# Altium schematic sheet LTE_Sheet.SchDoc
size 420 x 297 mm; SheetNumber: 11; SheetTotal: 12
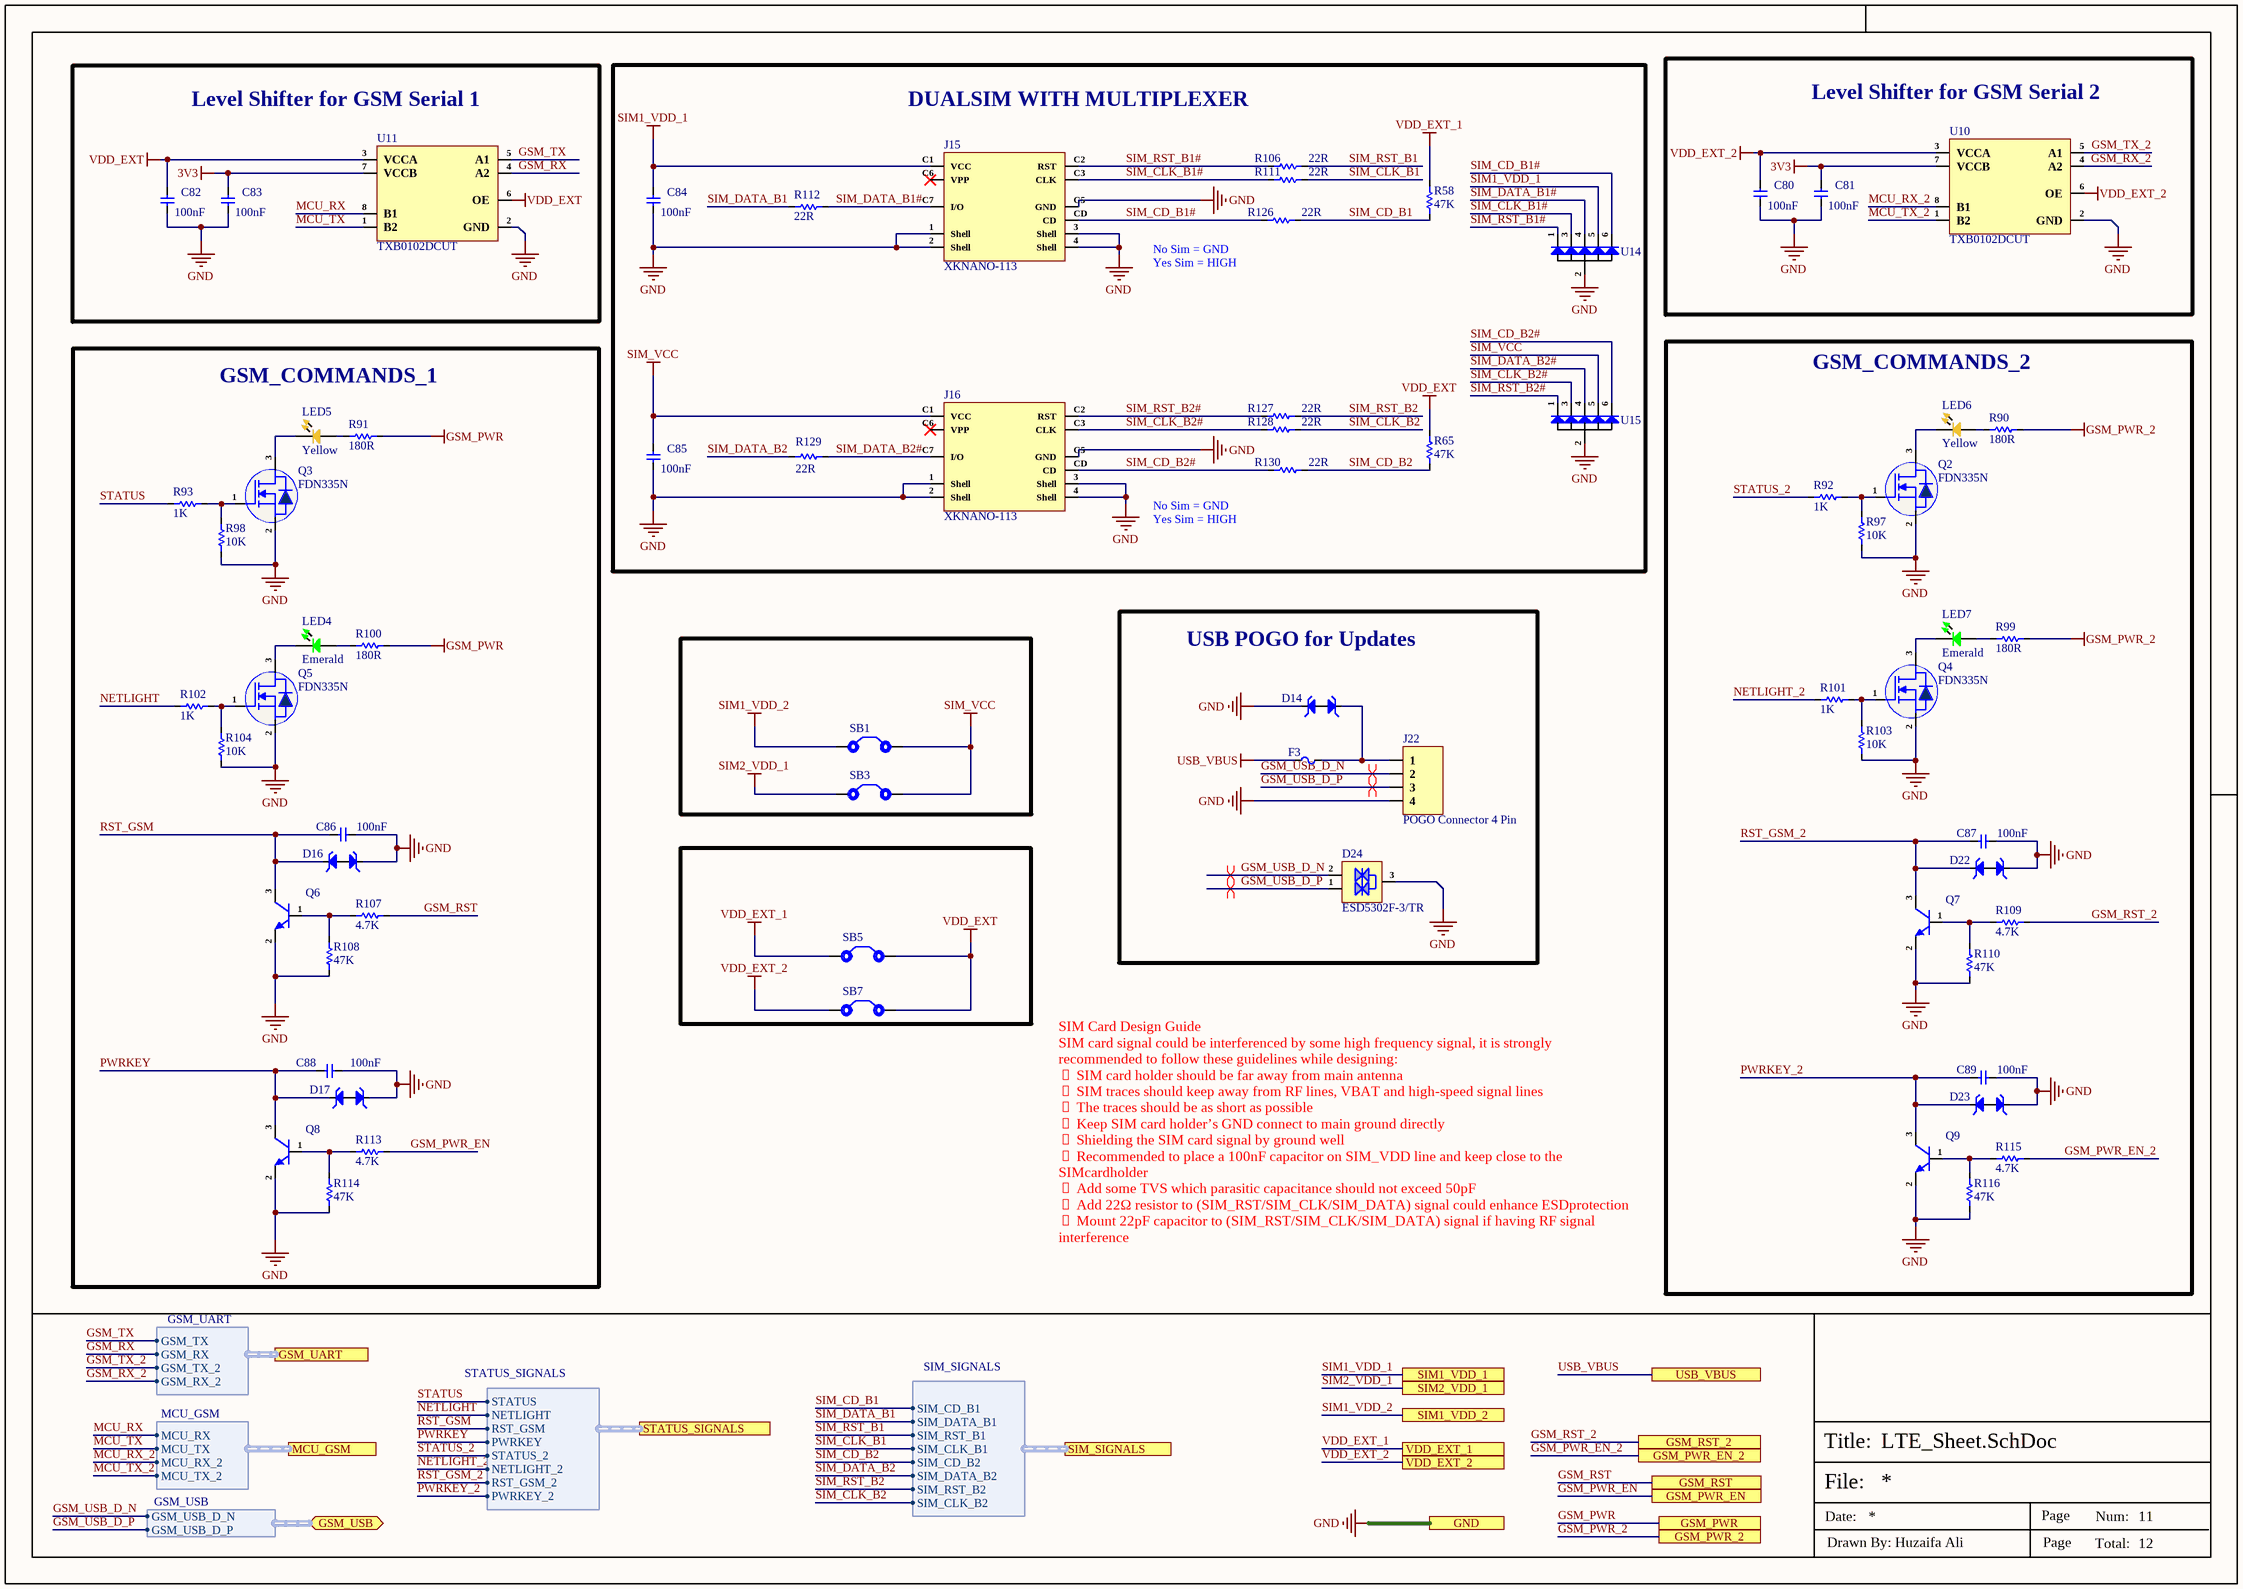
[diagram p0: LTE_Sheet.SchDoc]

## Parts
C80  100nF  [CAP-0201]
C81  100nF  [CAP-0201]
C82  100nF  [CAP-0201]
C83  100nF  [CAP-0201]
C84  100nF  [CAP-0201]
C85  100nF  [CAP-0201]
C86  100nF  [CAP-0201]
C87  100nF  [CAP-0201]
C88  100nF  [CAP-0201]
C89  100nF  [CAP-0201]
D14  PESD5V0H1BSFYL  [DSN0603-2]  (value not drawn)
D16  PESD5V0H1BSFYL  [DSN0603-2]  (value not drawn)
D17  PESD5V0H1BSFYL  [DSN0603-2]  (value not drawn)
D22  PESD5V0H1BSFYL  [DSN0603-2]  (value not drawn)
D23  PESD5V0H1BSFYL  [DSN0603-2]  (value not drawn)
D24  ESD5302F-3/TR  [Sot-23]
F3  SMD0603-050  [Fuse-0603]  (value not drawn)
J15  XKNANO-113  [XKNANO-113]
J16  XKNANO-113  [XKNANO-113]
J22  POGO Connector 4 Pin  [Pogo 4 Pin]
LED4  Emerald  [LED-0603]
LED5  Yellow  [LED-0603]
LED6  Yellow  [LED-0603]
LED7  Emerald  [LED-0603]
Q2  FDN335N  [SOT-23]
Q3  FDN335N  [SOT-23]
Q4  FDN335N  [SOT-23]
Q5  FDN335N  [SOT-23]
Q6  MMBT3904M  [SOT-723]  (value not drawn)
Q7  MMBT3904M  [SOT-723]  (value not drawn)
Q8  MMBT3904M  [SOT-723]  (value not drawn)
Q9  MMBT3904M  [SOT-723]  (value not drawn)
R58  47K  [Res-0201]
R65  47K  [Res-0201]
R90  180R  [Res-0201]
R91  180R  [Res-0201]
R92  1K  [Res-0603]
R93  1K  [Res-0603]
R97  10K  [Res-0201]
R98  10K  [Res-0201]
R99  180R  [Res-0201]
R100  180R  [Res-0201]
R101  1K  [Res-0603]
R102  1K  [Res-0603]
R103  10K  [Res-0201]
R104  10K  [Res-0201]
R106  22R  [Res-0201]
R107  4.7K  [Res-0603]
R108  47K  [Res-0603]
R109  4.7K  [Res-0603]
R110  47K  [Res-0603]
R111  22R  [Res-0201]
R112  22R  [Res-0201]
R113  4.7K  [Res-0603]
R114  47K  [Res-0603]
R115  4.7K  [Res-0603]
R116  47K  [Res-0603]
R126  22R  [Res-0201]
R127  22R  [Res-0201]
R128  22R  [Res-0201]
R129  22R  [Res-0201]
R130  22R  [Res-0201]
SB1  Solder Bridge 0603  [Solder Bridge]  (value not drawn)  (no BOM)
SB3  Solder Bridge 0603  [Solder Bridge]  (value not drawn)  (no BOM)
SB5  Solder Bridge 0603  [Solder Bridge]  (value not drawn)  (no BOM)
SB7  Solder Bridge 0603  [Solder Bridge]  (value not drawn)  (no BOM)
U10  TXB0102DCUT  [TXB0102DCUT]
U11  TXB0102DCUT  [TXB0102DCUT]
U14  SMF05CT1G-ES  [SOT-363]  (value not drawn)
U15  SMF05CT1G-ES  [SOT-363]  (value not drawn)

## Blocks framed on the sheet
Level Shifter for GSM Serial 1: C82 C83 U11
DUALSIM WITH MULTIPLEXER: C84 C85 J15 J16 R58 R65 R106 R111 R112 R126-R130 U14 U15
Level Shifter for GSM Serial 2: C80 C81 U10
GSM_COMMANDS_1: C86 C88 D16 D17 LED4 LED5 Q3 Q5 Q6 Q8 R91 R93 R98 R100 R102 R104 R107 R108 R113 R114
GSM_COMMANDS_2: C87 C89 D22 D23 LED6 LED7 Q2 Q4 Q7 Q9 R90 R92 R97 R99 R101 R103 R109 R110 R115 R116
USB POGO for Updates: D14 D24 F3 J22

## Ports
GND, GSM_PWR, GSM_PWR_2, GSM_PWR_EN, GSM_PWR_EN_2, GSM_RST, GSM_RST_2, GSM_UART (harness GSM_UART), GSM_USB (bidir, harness GSM_USB), MCU_GSM (harness MCU_GSM), SIM1_VDD_1, SIM1_VDD_2, SIM2_VDD_1, SIM_SIGNALS (harness SIM_SIGNALS), STATUS_SIGNALS (harness STATUS_SIGNALS), USB_VBUS, VDD_EXT_1, VDD_EXT_2

## Harnesses
SIM_SIGNALS: SIM_CD_B1, SIM_DATA_B1, SIM_RST_B1, SIM_CLK_B1, SIM_CD_B2, SIM_DATA_B2, SIM_RST_B2, SIM_CLK_B2
GSM_UART: GSM_TX, GSM_RX, GSM_TX_2, GSM_RX_2
MCU_GSM: MCU_RX, MCU_TX, MCU_RX_2, MCU_TX_2
STATUS_SIGNALS: NETLIGHT, STATUS, RST_GSM, PWRKEY, NETLIGHT_2, STATUS_2, RST_GSM_2, PWRKEY_2
GSM_USB: GSM_USB_D_N, GSM_USB_D_P

## Nets
3V3: C81.2 C83.2 U10.7(VCCB) U11.7(VCCB)
GND: C80.1 C81.1 C82.1 C83.1 C84.1 C85.1 C86.1 C87.1 C88.1 C89.1 D14.1 D16.2 D17.2 D22.2 D23.2 D24.3(GND) J15.1(Shell) J15.2(Shell) J15.3(Shell) J15.4(Shell) J15.C5(GND) J16.1(Shell) J16.2(Shell) J16.3(Shell) J16.4(Shell) J16.C5(GND) J22.4 Q2.2(S) Q3.2(S) Q4.2(S) Q5.2(S) Q6.2(E) Q7.2(E) Q8.2(E) Q9.2(E) R97.1 R98.1 R103.1 R104.1 R108.1 R110.1 R114.1 R116.1 U10.2(GND) U11.2(GND) U14.2(A) U15.2(A) ; port GND
GSM_PWR: R91.2 R100.2 ; port GSM_PWR
GSM_PWR_2: R90.2 R99.2 ; port GSM_PWR_2
SIM1_VDD_1: C84.2 J15.C1(VCC) U14.5(IO4) ; port SIM1_VDD_1
SIM1_VDD_2: SB1.1 ; port SIM1_VDD_2
SIM2_VDD_1: SB3.1 ; port SIM2_VDD_1
SIM_VCC: C85.2 J16.C1(VCC) SB1.2 SB3.2 U15.5(IO4)
USB_VBUS: F3.1 ; port USB_VBUS
VDD_EXT: C82.2 R65.2 SB5.2 SB7.2 U11.3(VCCA) U11.6(OE)
VDD_EXT_1: R58.2 SB5.1 ; port VDD_EXT_1
VDD_EXT_2: C80.2 SB7.1 U10.3(VCCA) U10.6(OE) ; port VDD_EXT_2
GSM_PWR_EN: R113.2 ; port GSM_PWR_EN
GSM_PWR_EN_2: R115.2 ; port GSM_PWR_EN_2
GSM_RST: R107.2 ; port GSM_RST
GSM_RST_2: R109.2 ; port GSM_RST_2
GSM_RX: U11.4(A2) ; port GSM_UART.GSM_RX
GSM_RX_2: U10.4(A2) ; port GSM_UART.GSM_RX_2
GSM_TX: U11.5(A1) ; port GSM_UART.GSM_TX
GSM_TX_2: U10.5(A1) ; port GSM_UART.GSM_TX_2
GSM_USB_D_N: D24.2(I/O2) J22.2 ; port GSM_USB.GSM_USB_D_N
GSM_USB_D_P: D24.1(I/O1) J22.3 ; port GSM_USB.GSM_USB_D_P
MCU_RX: U11.8(B1) ; port MCU_GSM.MCU_RX
MCU_RX_2: U10.8(B1) ; port MCU_GSM.MCU_RX_2
MCU_TX: U11.1(B2) ; port MCU_GSM.MCU_TX
MCU_TX_2: U10.1(B2) ; port MCU_GSM.MCU_TX_2
NETLIGHT: R102.1 ; port STATUS_SIGNALS.NETLIGHT
NETLIGHT_2: R101.1 ; port STATUS_SIGNALS.NETLIGHT_2
PWRKEY: C88.2 D17.1 Q8.3(C) ; port STATUS_SIGNALS.PWRKEY
PWRKEY_2: C89.2 D23.1 Q9.3(C) ; port STATUS_SIGNALS.PWRKEY_2
RST_GSM: C86.2 D16.1 Q6.3(C) ; port STATUS_SIGNALS.RST_GSM
RST_GSM_2: C87.2 D22.1 Q7.3(C) ; port STATUS_SIGNALS.RST_GSM_2
SIM_CD_B1: R58.1 R126.2 ; port SIM_SIGNALS.SIM_CD_B1
SIM_CD_B1#: J15.CD R126.1 U14.6(IO5)
SIM_CD_B2: R65.1 R130.2 ; port SIM_SIGNALS.SIM_CD_B2
SIM_CD_B2#: J16.CD R130.1 U15.6(IO5)
SIM_CLK_B1: R111.2 ; port SIM_SIGNALS.SIM_CLK_B1
SIM_CLK_B1#: J15.C3(CLK) R111.1 U14.3(IO2)
SIM_CLK_B2: R128.2 ; port SIM_SIGNALS.SIM_CLK_B2
SIM_CLK_B2#: J16.C3(CLK) R128.1 U15.3(IO2)
SIM_DATA_B1: R112.1 ; port SIM_SIGNALS.SIM_DATA_B1
SIM_DATA_B1#: J15.C7(I/O) R112.2 U14.4(IO3)
SIM_DATA_B2: R129.1 ; port SIM_SIGNALS.SIM_DATA_B2
SIM_DATA_B2#: J16.C7(I/O) R129.2 U15.4(IO3)
SIM_RST_B1: R106.2 ; port SIM_SIGNALS.SIM_RST_B1
SIM_RST_B1#: J15.C2(RST) R106.1 U14.1(IO1)
SIM_RST_B2: R127.2 ; port SIM_SIGNALS.SIM_RST_B2
SIM_RST_B2#: J16.C2(RST) R127.1 U15.1(IO1)
STATUS: R93.1 ; port STATUS_SIGNALS.STATUS
STATUS_2: R92.1 ; port STATUS_SIGNALS.STATUS_2
NetD14_2: D14.2 F3.2 J22.1
NetLED4_1: LED4.1 R100.1
NetLED4_2: LED4.2 Q5.3(D)
NetLED5_1: LED5.1 R91.1
NetLED5_2: LED5.2 Q3.3(D)
NetLED6_1: LED6.1 R90.1
NetLED6_2: LED6.2 Q2.3(D)
NetLED7_1: LED7.1 R99.1
NetLED7_2: LED7.2 Q4.3(D)
NetQ2_1: Q2.1(G) R92.2 R97.2
NetQ3_1: Q3.1(G) R93.2 R98.2
NetQ4_1: Q4.1(G) R101.2 R103.2
NetQ5_1: Q5.1(G) R102.2 R104.2
NetQ6_1: Q6.1(B) R107.1 R108.2
NetQ7_1: Q7.1(B) R109.1 R110.2
NetQ8_1: Q8.1(B) R113.1 R114.2
NetQ9_1: Q9.1(B) R115.1 R116.2

Not connected (* = marked no-connect by the designer): J15 C6(VPP)*; J16 C6(VPP)*

## Layout directives
differential pair; net class GSM_USB; differential pair class GSM_USB_Lines; rule Impedance Constraint [Min = 88.00    Max = 90.00    ]; rule Matched Net Lengths [Tolerance = 20mil]: GSM_USB_D_N, GSM_USB_D_P

## Notes on the sheet
- (near R126) No Sim = GND
  Yes Sim = HIGH
- (near R130) No Sim = GND
  Yes Sim = HIGH
- SIM Card Design Guide
  SIM card signal could be interferenced by some high frequency signal, it is strongly recommended to follow these guidelines while designing:
   SIM card holder should be far away from main antenna
   SIM traces should keep away from RF lines, VBAT and high-speed signal lines
   The traces should be as short as possible
   Keep SIM card holder’s GND connect to main ground directly
   Shielding the SIM card signal by ground well
   Recommended to place a 100nF capacitor on SIM_VDD line and keep close to the SIMcardholder
   Add some TVS which parasitic capacitance should not exceed 50pF
   Add 22Ω resistor to (SIM_RST/SIM_CLK/SIM_DATA) signal could enhance ESDprotection  Mount 22pF capacitor to (SIM_RST/SIM_CLK/SIM_DATA) signal if having RF signal interference
  Datasheet Pg 31
- File:
- Title:
- Date:
- Page
- Num:
- Total:
- Drawn By: Huzaifa Ali

## Library data of the parts
C80-C89 = CC0201KRX5R6BB104: CAP CER 0.1UF 10V X5R 0201; Manufacturer: Yageo; Tolerance: 10%; Supplier 1: Mouser; Manufacturer Part Number: CC0201KRX5R6BB104; RoHS: Yes; Category: Ceramic Capacitors; Stock 1: 824403; Pricing 1: 1=0.10000, 10=0.02400, 50=0.02400, 100=0.01900, 1000=0.01100, 10000=0.00900 (USD); Mount: Surface Mount; Case/Package: 0201; Case Code (Imperial): 0201; Case Code (Metric): 0603; Weight: 6E-06oz; Min Operating Temperature: -55°C; Max Operating Temperature: 85°C; Capacitance: 100nF; Dielectric: X5R; Voltage Rating (DC): 10V; Packaging: Tape and Reel; Termination: SMD/SMT; Resistor Type: Ceramic; Voltage Rating: 10V; Series: CC; Construction: Flat; Length: 0.6mm; Width: 0.012inch; Height: 0.3mm; Thickness: 0.013inch; Depth: 0.3mm; Radiation Hardening: No; Lead Free: Lead Free; Halogen Free: Halogen Free; RoHS Compliant: Yes; ComponentLink1URL: https://datasheet.ciiva.com/11587/upy-gphc-x5r-4v-to-50v-12-11587190.pdf?src-supplier=Avnet; ComponentLink1Description: https://datasheet.ciiva.com/11587/upy-gphc-x5r-4v-to-50v-12-11587190.pdf?src-supplier=Avnet; Supplier Part Number 1: 603-CC201KRX5R6BB104; LCSC Part Number: C190183
D14 D16 D17 D22 D23 = PESD5V0H1BSFYL: TVS DIODE 5VWM 6.3VC DSN0603-2; Manufacturer: Nexperia; Supplier 1: Avnet; Manufacturer Part Number: PESD5V0H1BSFYL; RoHS: Yes; Category: ESD and Circuit Protection ICs; Stock 1: 9000; Pricing 1: 18000=0.06453, 36000=0.06278, 54000=0.06104, 90000=0.05930, 180000=0.05755, 900000=0.05581, 1800000=0.05406 (USD); RoHS Compliant: Yes; ComponentLink1URL: http://www.farnell.com/datasheets/1961312.pdf?src-supplier=Farnell; ComponentLink1Description: http://www.farnell.com/datasheets/1961312.pdf?src-supplier=Farnell; ComponentLink2URL: https://assets.nexperia.com/documents/data-sheet/PESD5V0H1BSF.pdf?src-supplier=Digi-Key; ComponentLink2Description: https://assets.nexperia.com/documents/data-sheet/PESD5V0H1BSF.pdf?src-supplier=Digi-Key; ComponentLink3URL: http://www.farnell.com/datasheets/1961312.pdf?src-supplier=Newark; ComponentLink3Description: http://www.farnell.com/datasheets/1961312.pdf?src-supplier=Newark; Supplier Part Number 1: PESD5V0H1BSFYL; LCSC Part Number: C477989; Item Type: Diode
D24 = ESD5302F-3/TR: 16A 20V 7V 5V@Max Unidirectional SOT-23 TVS ROHS; Manufacturer: WILLSEMI; Item Type: Diode; Manufacturer Part Number: ESD5302F-3/TR; Package: SOT-23; LCSC Part Number: C239643; ComponentLink1Description: LCSC; ComponentLink1URL: https://www.lcsc.com/product-detail/TVS_WILLSEMI-Will-Semicon-ESD5302F-3-TR_C239643.html
F3 = SMD0603-050: 6V 500mA 40A 1A 0603 Resettable Fuses ROHS; Manufacturer: TECHFUSE; Item Type: Fuse; Supplier 1: LCSC; Manufacturer Part Number: SMD0603-050; RoHS: No; Category: Uncategorized; Supplier Part Number 1: C69679; LCSC Part Number: C69679; ComponentLink1Description: LCSC; ComponentLink1URL: https://www.lcsc.com/product-detail/Resettable-Fuses_TECHFUSE-SMD0603-050_C69679.html
J15 J16 = XKNANO-113: Copper Alloy Self bomb Gold plating 1.25mm Deck -40℃~+85℃ 260℃ NanoSIM SMD SIM Card Connectors ROHS; Manufacturer: XKB Connectivity; Manufacturer Part Number: XKNANO-113; Package: SMD Custom; LCSC Part Number: C381071; Item Type: SIM Card Connectors; ComponentLink1Description: LCSC; ComponentLink1URL: https://www.lcsc.com/product-detail/SIM-Card-Connectors_XKB-Connectivity-XKNANO-113_C381071.html
J22 = POGO Connector 4 Pin: Pogo Pad 2.5mm 4 Pin; Item Type: Pogo Connector; Manufacturer Part Number: POGO Connector 4 Pin
LED4 LED7 = NCD0603G2: Emerald 0603 Light Emitting Diodes (LED) ROHS; Manufacturer: Foshan NationStar Optoelectronics; Manufacturer Part Number: NCD0603G2; Package: 0603; LCSC Part Number: C87326; Item Type: LED; ComponentLink1Description: LCSC; ComponentLink1URL: https://www.lcsc.com/product-detail/Light-Emitting-Diodes-LED_Foshan-NationStar-Optoelectronics-NCD0603G2_C87326.html
LED5 LED6 = NCD0603Y2: yellow 0603 Light Emitting Diodes (LED) ROHS; Manufacturer: Foshan NationStar Optoelectronics; Manufacturer Part Number: NCD0603Y2; Package: 0603; LCSC Part Number: C89811; Item Type: LED; ComponentLink1Description: LCSC; ComponentLink1URL: https://www.lcsc.com/product-detail/Light-Emitting-Diodes-LED_Foshan-NationStar-Optoelectronics-NCD0603Y2_C89811.html
Q2-Q5 = FDN335N: SOT-23 MOSFETs ROHS; Manufacturer: TECH PUBLIC; Item Type: Mosfet; Manufacturer Part Number: FDN335N; Package: SOT-23; LCSC Part Number: C5123904; ComponentLink1Description: LCSC; ComponentLink1URL: https://www.lcsc.com/product-detail/MOSFETs_TECH-PUBLIC-FDN335N_C5123904.html
Q6-Q9 = MMBT3904M: 40V 100mW 100@10mA,1V 200mA 300MHz 300mV@50mA,5mA NPN -55℃~+150℃@(Tj) SOT-723 Bipolar Transistors - BJT ROHS; Manufacturer: TECH PUBLIC; Item Type: Mosfet; ComponentLink1Description: LCSC; ComponentLink1URL: https://www.lcsc.com/product-detail/Bipolar-Transistors-BJT_TECH-PUBLIC-MMBT3904M_C2923360.html; Manufacturer Part Number: MMBT3904M; Package: SOT-723; LCSC Part Number: C2923360
R58 R65 = RC0201FR-0747KL: RES 47K OHM 1% 1/20W 0201; Manufacturer: Yageo; Value: 47kR; Temperature Coefficient: 200ppm/°C; Power Rating: 50mW; Voltage Rating: 25V; Item Type: Resistor; Supplier: Future Electronics; Supplier Part Number: 7316417; Manufacturer Part Number: RC0201FR-0747KL; RoHS: Yes; Category: Chip SMD Resistors; Stock: 1020000; Pricing: 10000=0.0014, 50000=0.0013, 250000=0.0013, 750000=0.0012, 2000000=0.0011 (USD); Case/Package: 0201; Contact Plating: Tin,Matte; Case Code (Metric): 0603; Case Code (Imperial): 0201; Weight: 6E-06oz; Min Operating Temperature: -55°C; Max Operating Temperature: 125°C; Tolerance: 1%; Resistor Type: Thick Film; Packaging: Tape and Reel; Package Quantity: 10000; Number of Terminations: 2; Termination: SMD/SMT; Max Power Dissipation: 50mW; Features: Moisture Resistant; Series: RC; Resistance Tolerance: 1%; Construction: Rectangular; Length: 0.6mm; Width: 0.3mm; Height: 0.01inch; Depth: 0.3mm; Military Standard: Not; RoHS Compliant: Yes; Reach SVHC Compliant: Unknown; Lead Free: 5697LeadFree; ComponentLink1URL: https://datasheet.ciiva.com/7672/1563626-7672232.pdf?src-supplier=Element14; ComponentLink1Description: https://datasheet.ciiva.com/7672/1563626-7672232.pdf?src-supplier=Element14; ComponentLink2URL: https://datasheet.ciiva.com/29710/pyu-r-int-thick-7-29710919.pdf?src-supplier=Digi-Key; ComponentLink2Description: https://datasheet.ciiva.com/29710/pyu-r-int-thick-7-29710919.pdf?src-supplier=Digi-Key; ComponentLink3URL: https://datasheet.ciiva.com/29710/pyu-r-int-thick-7-29710920.pdf?src-supplier=Digi-Key; ComponentLink3Description: https://datasheet.ciiva.com/29710/pyu-r-int-thick-7-29710920.pdf?src-supplier=Digi-Key; ComponentLink4URL: https://datasheet.ciiva.com/25647/pyu-r-int-thick-7-25647310.pdf?src-supplier=Digi-Key; ComponentLink4Description: https://datasheet.ciiva.com/25647/pyu-r-int-thick-7-25647310.pdf?src-supplier=Digi-Key; ComponentLink5URL: https://datasheet.ciiva.com/26829/getdatasheetpartid-422496-26829867.pdf?src-supplier=Verical; ComponentLink5Description: https://datasheet.ciiva.com/26829/getdatasheetpartid-422496-26829867.pdf?src-supplier=Verical; ComponentLink6URL: https://datasheet.ciiva.com/8889/pyu-rc0201-51-rohs-l-8-8889065.pdf?src-supplier=Avnet; ComponentLink6Description: https://datasheet.ciiva.com/8889/pyu-rc0201-51-rohs-l-8-8889065.pdf?src-supplier=Avnet; LCSC Part Number: C138139
R90 R91 R99 R100 = AC0201FR-07180RL: RES SMD 180 OHM 1% 1/20W 0201; Manufacturer: Yageo; Max Power Dissipation: 50mW; Temperature Coefficient: 200ppm/°C; Item Type: Resistor; Supplier: Digi-Key; Supplier Part Number: YAG5164CT-ND; Manufacturer Part Number: AC0201FR-07180RL; RoHS: Yes; Category: Chip SMD Resistors; Stock: 11641; Pricing: 1=0.1, 10=0.037, 50=0.024, 100=0.0203, 500=0.01412, 1000=0.0123, 5000=0.00915 (USD); Case/Package: 0201; Min Operating Temperature: -55°C; Max Operating Temperature: 155°C; Packaging: Tape and Reel; Value: 180R; Number of Terminations: 2; Tolerance: 1%; Features: Moisture Resistant,Automotive AEC-Q200; Series: AC; Length: 0.024inch; Width: 0.012inch; Height: 0.01inch; RoHS Compliant: Yes; ComponentLink1URL: http://www.yageo.com/NewPortal/yageodocoutput?fileName=/pdf/R-Chip/PYu-AC_51_RoHS_L_5.pdf&src-supplier=Digi-Key; ComponentLink1Description: http://www.yageo.com/NewPortal/yageodocoutput?fileName=/pdf/R-Chip/PYu-AC_51_RoHS_L_5.pdf&src-supplier=Digi-Key; ComponentLink2URL: http://www.yageo.com/NewPortal/yageodocoutput?fileName=/pdf/R-Chip/PYu-AC_51_RoHS_L_6.pdf&src-supplier=Digi-Key; ComponentLink2Description: http://www.yageo.com/NewPortal/yageodocoutput?fileName=/pdf/R-Chip/PYu-AC_51_RoHS_L_6.pdf&src-supplier=Digi-Key; LCSC Part Number: C226435
R92 R93 R101 R102 = CRCW06031K00FKEA: RES SMD 1K OHM 1% 1/10W 0603; Manufacturer: Vishay Dale; Item Type: Resistor; Value: 1kR; Voltage Rating: 75V; Temperature Coefficient: 100ppm/°C; Power Rating: 100mW; LCSC Part Number: C844920; ComponentLink2URL: https://datasheet.ciiva.com/11808/0900766b80d98afc-11808625.pdf?src-supplier=Rs; ComponentLink2Description: https://datasheet.ciiva.com/11808/0900766b80d98afc-11808625.pdf?src-supplier=Rs; ComponentLink3URL: https://datasheet.ciiva.com/46441/1720486-46441623.pdf?src-supplier=Element14; ComponentLink3Description: https://datasheet.ciiva.com/46441/1720486-46441623.pdf?src-supplier=Element14; ComponentLink4URL: https://datasheet.ciiva.com/46441/1720486-46441622.pdf?src-supplier=Element14; ComponentLink4Description: https://datasheet.ciiva.com/46441/1720486-46441622.pdf?src-supplier=Element14; ComponentLink5URL: https://datasheet.ciiva.com/26316/fld-crcw-e3-data-en-26316551.pdf?src-supplier=Distrelec; ComponentLink5Description: https://datasheet.ciiva.com/26316/fld-crcw-e3-data-en-26316551.pdf?src-supplier=Distrelec; ComponentLink6URL: https://datasheet.ciiva.com/2465/dcrcwe3-2465536.pdf?src-supplier=Digi-Key; ComponentLink6Description: https://datasheet.ciiva.com/2465/dcrcwe3-2465536.pdf?src-supplier=Digi-Key; ComponentLink7URL: https://datasheet.ciiva.com/2465/dcrcwe3-2465534.pdf?src-supplier=Digi-Key; ComponentLink7Description: https://datasheet.ciiva.com/2465/dcrcwe3-2465534.pdf?src-supplier=Digi-Key; ComponentLink8URL: https://datasheet.ciiva.com/16199/dcrcwe3-16199053.pdf?src-supplier=Future+Electronics; ComponentLink8Description: https://datasheet.ciiva.com/16199/dcrcwe3-16199053.pdf?src-supplier=Future+Electronics; ComponentLink9URL: https://datasheet.ciiva.com/46385/1697337-46385497.pdf?src-supplier=Element14; ComponentLink9Description: https://datasheet.ciiva.com/46385/1697337-46385497.pdf?src-supplier=Element14; ComponentLink10URL: https://datasheet.ciiva.com/2465/dcrcwe3-2465535.pdf?src-supplier=Digi-Key; ComponentLink10Description: https://datasheet.ciiva.com/2465/dcrcwe3-2465535.pdf?src-supplier=Digi-Key; ComponentLink11URL: https://datasheet.ciiva.com/8336/dcrcwe3-8336822.pdf?src-supplier=Avnet; ComponentLink11Description: https://datasheet.ciiva.com/8336/dcrcwe3-8336822.pdf?src-supplier=Avnet; ComponentLink12URL: https://datasheet.ciiva.com/3257/dcrcwe3-3257132.pdf?src-supplier=Avnet; ComponentLink12Description: https://datasheet.ciiva.com/3257/dcrcwe3-3257132.pdf?src-supplier=Avnet; Supplier: Mouser; Supplier Part Number: 71-CRCW0603-1.0K-E3; Manufacturer Part Number: CRCW06031K00FKEA; RoHS: Yes; Category: Chip SMD Resistors; Stock: 1295653; Pricing: 1=0.1, 10=0.017, 50=0.017, 100=0.01, 1000=0.008, 10000=0.004 (USD); Case/Package: 0603; Pins: 2; Contact Plating: Tin; Weight: 7.1E-05oz; Case Code (Metric): 1608; Case Code (Imperial): 0603; Min Operating Temperature: -55°C; Max Operating Temperature: 155°C; Tolerance: 1%; Resistor Type: Thick Film; Packaging: Tape and Reel; Package Quantity: 5000; Number of Terminations: 2; Termination: SMD/SMT; Max Power Dissipation: 100mW; Features: Automotive AEC-Q200; Series: CRCW; Technology: THICK FILM; Resistance Tolerance: 1%; Voltage Rating (DC): 75V; Construction: Rectangular; Length: 1.55mm; Width: 0.85mm; Height: 0.45mm; Depth: 0.85mm; Ratings: AEC-Q200; Radiation Hardening: No; RoHS Compliant: Yes; Reach SVHC Compliant: Unknown; Lead Free: 5697LeadFree; Military Standard: Not; ComponentLink1URL: https://datasheet.ciiva.com/11808/0900766b80d98afc-11808625.pdf?src-supplier=Rs; ComponentLink1Description: https://datasheet.ciiva.com/11808/0900766b80d98afc-11808625.pdf?src-supplier=Rs; ComponentLink13URL: https://datasheet.ciiva.com/2465/dcrcwe3-2465535.pdf?src-supplier=Digikey; ComponentLink13Description: https://datasheet.ciiva.com/2465/dcrcwe3-2465535.pdf?src-supplier=Digikey; ComponentLink14URL: https://datasheet.ciiva.com/2465/dcrcwe3-2465536.pdf?src-supplier=Digikey; ComponentLink14Description: https://datasheet.ciiva.com/2465/dcrcwe3-2465536.pdf?src-supplier=Digikey; ComponentLink15URL: https://datasheet.ciiva.com/2465/dcrcwe3-2465534.pdf?src-supplier=Digikey; ComponentLink15Description: https://datasheet.ciiva.com/2465/dcrcwe3-2465534.pdf?src-supplier=Digikey
R97 R98 R103 R104 = RC0201FR-0710KL: RES SMD 10K OHM 1% 1/20W 0201; Manufacturer: Yageo; Item Type: Resistor; Manufacturer Part Number: RC0201FR-0710KL; Package: 0201; ComponentLink7Description: LCSC; ComponentLink7URL: https://www.lcsc.com/product-detail/Chip-Resistor-Surface-Mount_YAGEO-RC0201FR-0710KL_C106225.html; LCSC Part Number: C106225
R106 R111 R112 R126-R130 = RC0201FR-0722RL: RES 22 OHM 1% 1/20W 0201; Manufacturer: Yageo; Item Type: Resistor; Supplier: Future Electronics; Supplier Part Number: 5973409; Manufacturer Part Number: RC0201FR-0722RL; RoHS: Yes; Category: Chip SMD Resistors; Stock: 17980000; Pricing: 10000=0.0014, 50000=0.0013, 250000=0.0013, 750000=0.0012, 2000000=0.0011 (USD); ComponentLink1URL: https://datasheet.ciiva.com/7672/1563626-7672215.pdf?src-supplier=Element14; ComponentLink1Description: https://datasheet.ciiva.com/7672/1563626-7672215.pdf?src-supplier=Element14; LCSC Part Number: C155743
R107 R109 R113 R115 = RC0603JR-074K7L: RES SMD 4.7K OHM 5% 1/10W 0603; Manufacturer: Yageo; Resistance: 4.7kR; Temperature Coefficient: 100ppm/°C; Voltage Rating (DC): 50V; Power Rating: 100mW; Item Type: Resistor; Supplier 1: Digi-Key; Manufacturer Part Number: RC0603JR-074K7L; Stock 1: 19706643; Pricing 1: 1=0.1, 10=0.02, 100=0.0081, 1000=0.00362, 2500=0.00314 (USD); Case/Package: 0603; Number of Pins: 2; Case Code (Imperial): 0603; Case Code (Metric): 1608; Min Operating Temperature: -55°C; Max Operating Temperature: 155°C; Tolerance: 5%; Composition: Thick Film; Packaging: Tape and Reel; Voltage Rating: 50V; Termination: SMD/SMT; Military Standard: Not; Length: 1.6mm; Width: 0.8mm; Depth: 0.8mm; REACH SVHC: No SVHC; Lead Free: Lead Free; ComponentLink1URL: http://www.farnell.com/datasheets/443971.pdf?src-supplier=Element14; ComponentLink1Description: http://www.farnell.com/datasheets/443971.pdf?src-supplier=Element14; Supplier Part Number 1: 311-4.7KGRCT-ND; LCSC Part Number: C105428
R108 R110 R114 R116 = RC0603JR-0747KL: RES 47K OHM 5% 1/10W 0603; Manufacturer: Yageo; Resistance: 47kR; Power Rating: 100mW; Voltage Rating (DC): 50V; Temperature Coefficient: 100ppm/°C; Resistance Tolerance: 1%; Supplier 1: Arrow; Manufacturer Part Number: RC0603JR-0747KL; Stock 1: 599135; Pricing 1: 5000=0.0025, 10000=0.0022, 25000=0.0019, 1=0.0011, 6000=0.001 (USD); Case/Package: 0603; Number of Pins: 2; Case Code (Imperial): 0603; Case Code (Metric): 1608; Min Operating Temperature: -55°C; Max Operating Temperature: 155°C; Packaging: Tape and Reel; Tolerance: 5%; Voltage Rating: 50V; Package Quantity: 5000; Termination: SMD/SMT; Military Standard: Not; Composition: Thick Film; Length: 1.6mm; Height: 0.45mm; Width: 0.8mm; Depth: 0.8mm; REACH SVHC: No SVHC; Lead Free: Lead Free; ComponentLink1URL: http://www.farnell.com/datasheets/443971.pdf; ComponentLink1Description: http://www.farnell.com/datasheets/443971.pdf; ComponentLink2URL: http://www.mouser.com/catalog/specsheets/RC0603.pdf; ComponentLink2Description: http://www.mouser.com/catalog/specsheets/RC0603.pdf; Supplier Part Number 1: RC0603JR-0747KL; Supplier 2: Digi-Key; RoHS: Yes; Category: Chip SMD Resistors; Stock 2: 1087850; Pricing 2: 1=0.10000, 10=0.02300, 100=0.00930, 1000=0.00417, 2500=0.00362 (USD); Size Code: 0603; Number of Terminations: 2; Resistor Type: Thick Film; Features: Moisture Resistant; Series: RC; Max Power Dissipation: 100mW; Construction: Rectangular; RoHS Compliant: Yes; ComponentLink3URL: https://datasheet.ciiva.com/46395/443971-46395003.pdf?src-supplier=Element14; ComponentLink3Description: https://datasheet.ciiva.com/46395/443971-46395003.pdf?src-supplier=Element14; ComponentLink4URL: https://datasheet.ciiva.com/12558/rc0603-272842-12558744.pdf?src-supplier=Mouser; ComponentLink4Description: https://datasheet.ciiva.com/12558/rc0603-272842-12558744.pdf?src-supplier=Mouser; Supplier Part Number 2: 311-30.0KHRCT-ND; LCSC Part Number: C127447
SB1 SB3 SB5 SB7 = Solder Bridge 0603: Solder Bridge ON; Manufacturer Part Number: Solder Bridge; Item Type: Solder Bridge
U10 U11 = TXB0102DCUT: IC TRNSLTR BIDIRECTIONAL US8; Manufacturer: Texas Instruments; Propagation Delay: 31ns; Min Supply Voltage: 1.65V; Max Supply Voltage: 5.5V; Data Rate: 100Mbps; Number of Channels: 2; Logic Function: Translator; Turn-On Delay Time: 7.4ns; High Level Output Current: -20uA; Low Level Output Current: 20uA; Output Type: 3-STATE; Output Current: 50mA; Supplier 1: Arrow Electronics; Manufacturer Part Number: TXB0102DCUT; RoHS: Yes; Category: Integrated Circuits (ICs); Stock 1: 10; Pricing 1: 1=0.79330, 10=0.66470, 25=0.65820, 250=0.37450, 500=0.36200, 1000=0.29770, 2500=0.28440 (USD); Mount: Surface Mount; Case/Package: VSSOP; Number of Pins: 8; Weight: 0.000339oz; Contact Plating: Gold; Min Operating Temperature: -40°C; Max Operating Temperature: 85°C; Packaging: Tape and Reel; Package Quantity: 1; Number of Bits: 2; Series: -; Number of Inputs: 2; Length: 2.3mm; Width: 2mm; Height: 0.85mm; Radiation Hardening: No; Lead Free: Lead Free; RoHS Compliant: Yes; REACH SVHC: No SVHC; ComponentLink1URL: https://datasheet.ciiva.com/4226/sces641b-4226901.pdf?src-supplier=Arrow+Electronics; ComponentLink1Description: https://datasheet.ciiva.com/4226/sces641b-4226901.pdf?src-supplier=Arrow+Electronics; ComponentLink2URL: https://datasheet.ciiva.com/15096/getdatasheetpartid-226009-15096242.pdf?src-supplier=Verical; ComponentLink2Description: https://datasheet.ciiva.com/15096/getdatasheetpartid-226009-15096242.pdf?src-supplier=Verical; ComponentLink3URL: https://datasheet.ciiva.com/14287/txb0102-14287498.pdf?src-supplier=Avnet; ComponentLink3Description: https://datasheet.ciiva.com/14287/txb0102-14287498.pdf?src-supplier=Avnet; ComponentLink4URL: https://datasheet.ciiva.com/14287/txb0102-14287370.pdf?src-supplier=Avnet; ComponentLink4Description: https://datasheet.ciiva.com/14287/txb0102-14287370.pdf?src-supplier=Avnet; ComponentLink5URL: https://datasheet.ciiva.com/6619/txb0102-6619255.pdf?src-supplier=Digi-Key; ComponentLink5Description: https://datasheet.ciiva.com/6619/txb0102-6619255.pdf?src-supplier=Digi-Key; ComponentLink6URL: https://datasheet.ciiva.com/6619/txb0102-6619256.pdf?src-supplier=Digi-Key; ComponentLink6Description: https://datasheet.ciiva.com/6619/txb0102-6619256.pdf?src-supplier=Digi-Key; ComponentLink7URL: https://datasheet.ciiva.com/6619/txb0102-6619257.pdf?src-supplier=Digi-Key; ComponentLink7Description: https://datasheet.ciiva.com/6619/txb0102-6619257.pdf?src-supplier=Digi-Key; Supplier Part Number 1: TXB0102DCUT
U14 U15 = SMF05CT1G-ES: 15V 5 Unidirectional 5V SOT-363 ESD Protection Devices ROHS; Manufacturer: ElecSuper; Item Type: ESD Diode; Manufacturer Part Number: SMF05CT1G-ES; Package: SOT-363; LCSC Part Number: C5180312; ComponentLink1Description: LCSC; ComponentLink1URL: https://www.lcsc.com/product-detail/ESD-Protection-Devices_ElecSuper-SMF05CT1G-ES_C5180312.html